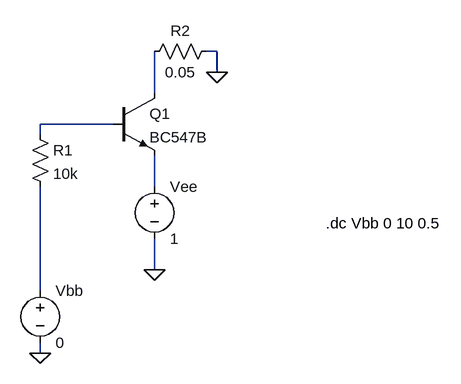
[diagram p0: schematic commoncollectorinput.asc]
commoncollectorinput.asc, the LTspice schematic file:
Version 4.1
SHEET 1 880 680
WIRE 256 -48 240 -48
WIRE 256 -16 256 -48
WIRE 160 16 160 -48
WIRE 96 64 -16 64
WIRE -16 80 -16 64
WIRE 160 160 160 112
WIRE 160 288 160 240
WIRE -16 320 -16 160
WIRE -16 416 -16 400
FLAG 256 -16 0
FLAG -16 416 0
FLAG 160 288 0
SYMBOL npn 96 16 R0
SYMATTR InstName Q1
SYMATTR Value BC547B
SYMBOL res -32 64 R0
SYMATTR InstName R1
SYMATTR Value 10k
SYMBOL voltage -16 304 R0
SYMATTR InstName Vbb
SYMATTR Value 0
SYMBOL voltage 160 144 R0
WINDOW 123 0 0 Left 0
WINDOW 39 0 0 Left 0
SYMATTR InstName Vee
SYMATTR Value 1
SYMBOL res 256 -64 R90
WINDOW 0 0 56 VBottom 2
WINDOW 3 32 56 VTop 2
SYMATTR InstName R2
SYMATTR Value 0.05
TEXT 424 216 Left 2 !.dc Vbb 0 10 0.5

The netlist it stands for:
* commoncollectorinput.asc
Q1 N001 N002 N003 0 BC547B
R1 N002 N004 10k
Vbb N004 0 0
Vee N003 0 1
R2 0 N001 0.05
.model NPN NPN
.model PNP PNP
.lib standard.bjt
.dc Vbb 0 10 0.5
.backanno
.end